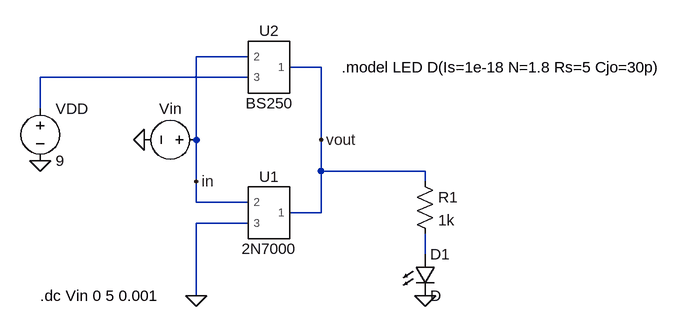
[diagram p0: schematic circuit_l2.asc]
circuit_l2.asc, the LTspice schematic file:
Version 4.1
SHEET 1 1216 680
WIRE -240 16 -320 16
WIRE -128 32 -176 32
WIRE -240 48 -560 48
WIRE -560 96 -560 48
WIRE -320 144 -320 16
WIRE -128 144 -128 32
WIRE -128 192 -128 144
WIRE 32 192 -128 192
WIRE -320 208 -320 144
WIRE 32 208 32 192
WIRE -320 240 -320 208
WIRE -240 240 -320 240
WIRE -128 256 -128 192
WIRE -128 256 -176 256
WIRE -240 272 -320 272
WIRE 32 320 32 288
WIRE -320 384 -320 272
FLAG -320 384 0
FLAG -400 144 0
FLAG -560 176 0
FLAG -128 144 vout
FLAG 32 384 0
FLAG -320 208 in
SYMBOL 2N7000 -208 256 M0
SYMATTR InstName U1
SYMBOL BS250 -208 32 M0
SYMATTR InstName U2
SYMBOL voltage -304 144 R90
WINDOW 0 -32 56 VBottom 2
WINDOW 3 -11 -5 Bottom 2
WINDOW 123 0 0 Left 0
WINDOW 39 0 0 Left 0
SYMATTR InstName Vin
SYMATTR Value ""
SYMBOL voltage -560 80 R0
WINDOW 123 0 0 Left 0
WINDOW 39 0 0 Left 0
SYMATTR InstName VDD
SYMATTR Value 9
SYMBOL res 16 192 R0
SYMATTR InstName R1
SYMATTR Value 1k
SYMBOL LED 16 320 R0
SYMATTR InstName D1
TEXT -96 32 Left 2 !.model LED D(Is=1e-18 N=1.8 Rs=5 Cjo=30p)
TEXT -560 384 Left 2 !.dc Vin 0 5 0.001

The netlist it stands for:
* circuit_l2.asc
X§U1 vout in 0 2N7000  ; pins 1 2 3
X§U2 vout in N001 BS250  ; pins 1 2 3
Vin in 0
VDD N001 0 9
R1 vout N002 1k
D1 N002 0 D
.model D D
.lib standard.dio
.model LED D(Is=1e-18 N=1.8 Rs=5 Cjo=30p)
.dc Vin 0 5 0.001
.lib 2N7000.onsemi.lib
.lib BS250.philips.lib
.backanno
.end

* Results of the author's LTspice run, read from the files saved beside the schematic
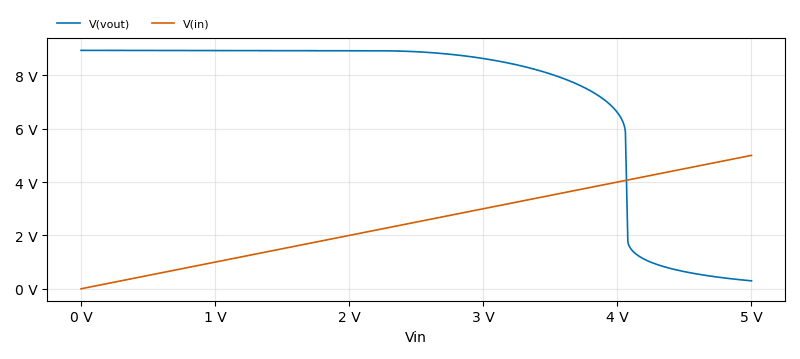
[diagram p1: DC transfer characteristic of circuit_l2.asc, plotted from the saved traces]
* DC transfer characteristic, 1 run:
*   V(vout): 8.935 V at Vin=0 V, 297.8 mV at Vin=5 V, min 297.8 mV, max 8.935 V
*   V(in): 0 V at Vin=0 V, 5 V at Vin=5 V, min 0 V, max 5 V